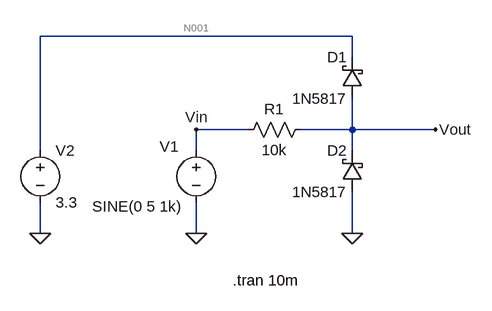
[diagram p0: schematic Series_Clamp.asc]
Series_Clamp.asc, the LTspice schematic file:
Version 4.1
SHEET 1 880 680
WIRE 352 -48 -128 -48
WIRE 352 -16 352 -48
WIRE 192 96 112 96
WIRE 352 96 352 48
WIRE 352 96 272 96
WIRE 480 96 352 96
WIRE -128 128 -128 -48
WIRE 112 128 112 96
WIRE 352 128 352 96
WIRE -128 256 -128 208
WIRE 112 256 112 208
WIRE 352 256 352 192
FLAG 112 256 0
FLAG 352 256 0
FLAG -128 256 0
FLAG 112 96 Vin
FLAG 480 96 Vout
SYMBOL voltage 112 112 R0
WINDOW 0 -56 10 Left 2
WINDOW 3 -160 102 Left 2
WINDOW 123 0 0 Left 0
WINDOW 39 0 0 Left 0
SYMATTR InstName V1
SYMATTR Value SINE(0 5 1k)
SYMBOL res 288 80 R90
WINDOW 0 0 56 VBottom 2
WINDOW 3 32 56 VTop 2
SYMATTR InstName R1
SYMATTR Value 10k
SYMBOL schottky 368 48 R180
WINDOW 0 24 64 Left 2
WINDOW 3 24 0 Left 2
SYMATTR InstName D1
SYMATTR Value 1N5817
SYMATTR Description Diode
SYMATTR Type diode
SYMBOL schottky 368 192 R180
WINDOW 0 24 64 Left 2
WINDOW 3 24 0 Left 2
SYMATTR InstName D2
SYMATTR Value 1N5817
SYMATTR Description Diode
SYMATTR Type diode
SYMBOL voltage -128 112 R0
WINDOW 123 0 0 Left 0
WINDOW 39 0 0 Left 0
SYMATTR InstName V2
SYMATTR Value 3.3
TEXT 168 328 Left 2 !.tran 10m

The netlist it stands for:
* Series_Clamp.asc
V1 Vin 0 SINE(0 5 1k)
R1 Vout Vin 10k
D1 Vout N001 1N5817
D2 0 Vout 1N5817
V2 N001 0 3.3
.model D D
.lib standard.dio
.tran 10m
.backanno
.end

* Results of the author's LTspice run, read from the files saved beside the schematic
* Operating Point, zero values left out:
*   V(n001) = 3.3 V
*   V(vout) = 59.44 mV
*   I(D1) = -31.7 µA
*   I(D2) = -25.76 µA
*   I(R1) = 5.944 µA
*   I(V1) = 5.944 µA
*   I(V2) = -31.7 µA
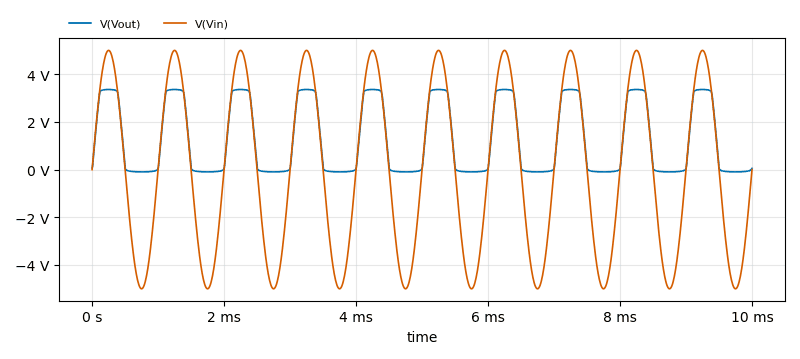
[diagram p1: Transient Analysis of Series_Clamp.asc, plotted from the saved traces]
* Transient Analysis, 1 run:
*   V(Vout): min -97.28 mV, max 3.358 V, average 1.262 V, rms 1.977 V, last 50.2 mV
*   V(Vin): min -5 V, max 5 V, average 42.85 µV, rms 3.535 V, last 0 V